# Altium schematic sheet Driver.SchDoc
size A4
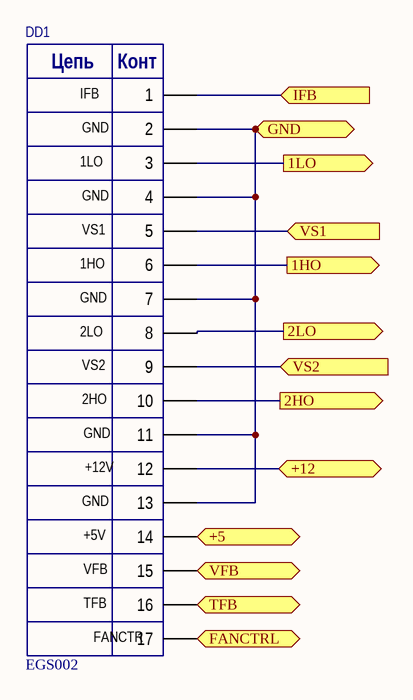
[diagram p0: Driver.SchDoc]

## Parts
DD1  EGS002  [EGS002]

## Ports
1HO (out), 1LO (out), 2HO (out), 2LO (out), +5, +12, FANCTRL (out), GND, IFB (in), TFB (in), VFB (in), VS1 (in), VS2 (in)

## Nets
1HO: DD1.6 ; port 1HO
1LO: DD1.3 ; port 1LO
2HO: DD1.10 ; port 2HO
2LO: DD1.8 ; port 2LO
+5: DD1.14 ; port +5
+12: DD1.12 ; port +12
FANCTRL: DD1.17 ; port FANCTRL
GND: DD1.2 DD1.4 DD1.7 DD1.11 DD1.13 ; port GND
IFB: DD1.1 ; port IFB
TFB: DD1.16 ; port TFB
VFB: DD1.15 ; port VFB
VS1: DD1.5 ; port VS1
VS2: DD1.9 ; port VS2

## Notes on the sheet
- (in symbol EGS002) Цепь; Конт; IFB; GND; 1LO; VS1; 1HO; 2LO; VS2; 2HO; +12V; +5V; VFB; TFB; FANCTR